# EAGLE design SmartTraffic_Shield_UNO_R3 (EAGLE 9.3.1)
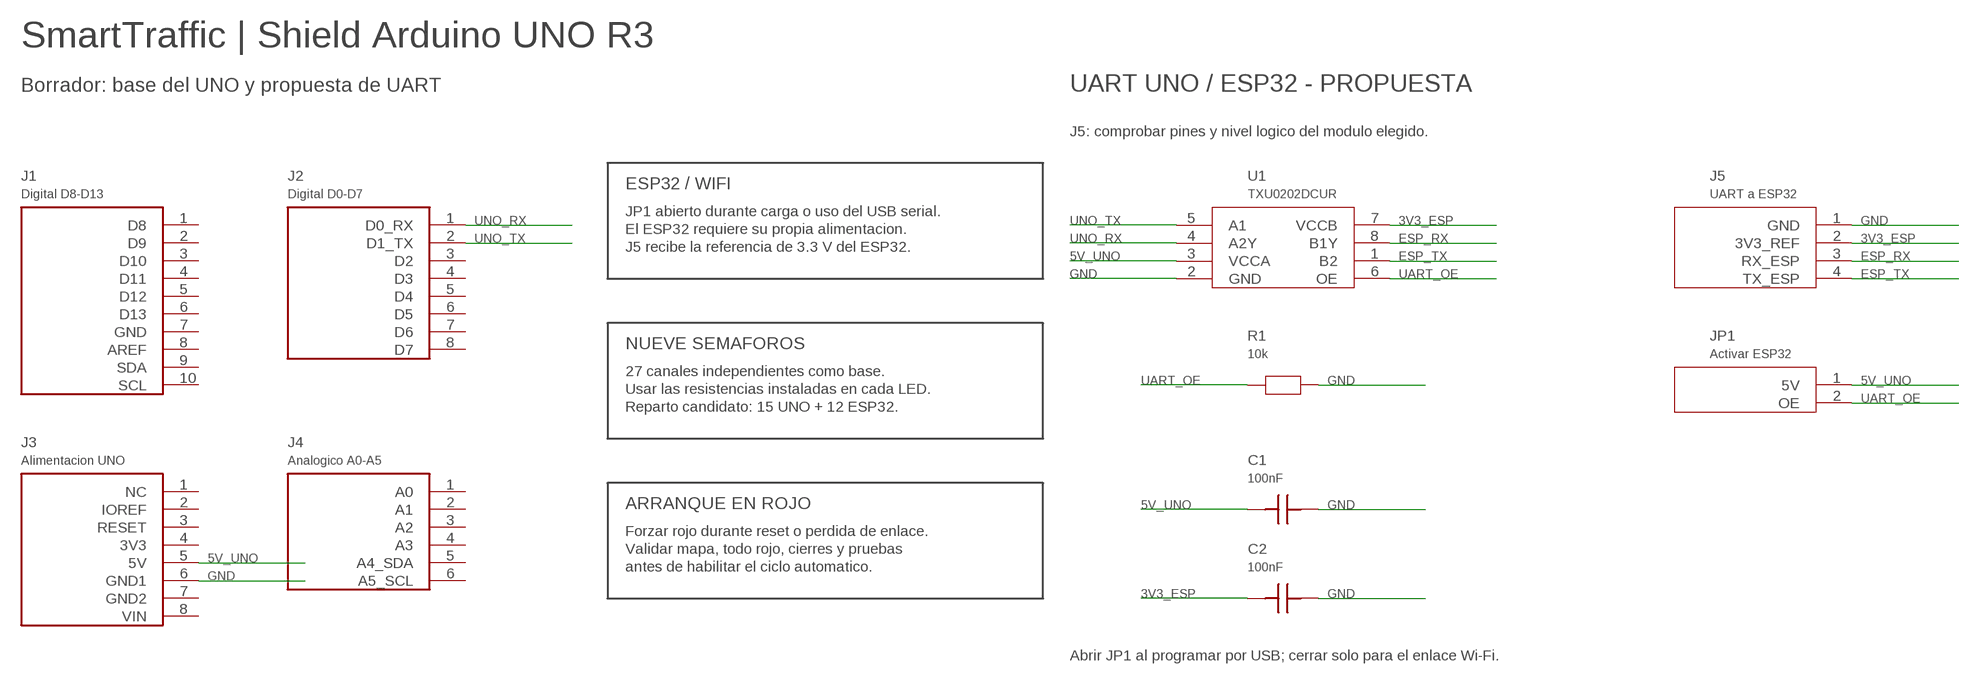
[diagram p0: schematic, sheet 1]

## Parts
C1  100nF  UART_BYPASS_5V  [C_0805]
C2  100nF  UART_BYPASS_3V3  [C_0805]
J1  Digital D8-D13  UNO_IOH  [SHIELD_1X10_P2.54]
J2  Digital D0-D7  UNO_IOL  [SHIELD_1X08_P2.54]
J3  Alimentacion UNO  UNO_POWER  [SHIELD_1X08_P2.54]
J4  Analogico A0-A5  UNO_AD  [SHIELD_1X06_P2.54]
J5  UART a ESP32  ESP32_UART  [SHIELD_1X04_P2.54]
JP1  Activar ESP32  UART_ENABLE  [SHIELD_1X02_P2.54]
R1  10k  UART_OE_PULLDOWN  [R_0805]
U1  TXU0202DCUR  UART_TXU0202  [VSSOP8_DCU0008A]

## Nets
3V3_ESP: C2.1 J5.2(3V3_REF) U1.7(VCCB)
5V_UNO: C1.1 J3.5(5V) JP1.1(5V) U1.3(VCCA)
ESP_RX: J5.3(RX_ESP) U1.8(B1Y)
ESP_TX: J5.4(TX_ESP) U1.1(B2)
GND: C1.2 C2.2 J3.6(GND1) J5.1(GND) R1.2 U1.2(GND)
UART_OE: JP1.2(OE) R1.1 U1.6(OE)
UNO_RX: J2.1(D0_RX) U1.4(A2Y)
UNO_TX: J2.2(D1_TX) U1.5(A1)
Unconnected: J1.1(D8) J1.2(D9) J1.3(D10) J1.4(D11) J1.5(D12) J1.6(D13) J1.7(GND) J1.8(AREF) J1.9(SDA) J1.10(SCL) J2.3(D2) J2.4(D3) J2.5(D4) J2.6(D5) J2.7(D6) J2.8(D7) J3.1(NC) J3.2(IOREF) J3.3(RESET) J3.4(3V3) J3.7(GND2) J3.8(VIN) J4.1(A0) J4.2(A1) J4.3(A2) J4.4(A3) J4.5(A4_SDA) J4.6(A5_SCL)

## Notes on the sheet
- SmartTraffic | Shield Arduino UNO R3
- Borrador: base del UNO y propuesta de UART | UART UNO / ESP32 - PROPUESTA
- J5: comprobar pines y nivel logico del modulo elegido.
- ESP32 / WIFI
- JP1 abierto durante carga o uso del USB serial.
- El ESP32 requiere su propia alimentacion.
- J5 recibe la referencia de 3.3 V del ESP32.
- NUEVE SEMAFOROS
- 27 canales independientes como base.
- Usar las resistencias instaladas en cada LED.
- Reparto candidato: 15 UNO + 12 ESP32.
- ARRANQUE EN ROJO
- Forzar rojo durante reset o perdida de enlace.
- Validar mapa, todo rojo, cierres y pruebas
- antes de habilitar el ciclo automatico.
- Abrir JP1 al programar por USB; cerrar solo para el enlace Wi-Fi.

## Library data of the parts
C1 = SmartTraffic_Shield:UART_BYPASS_5V
C2 = SmartTraffic_Shield:UART_BYPASS_3V3
J1 = SmartTraffic_Shield:UNO_IOH
J2 = SmartTraffic_Shield:UNO_IOL
J3 = SmartTraffic_Shield:UNO_POWER
J4 = SmartTraffic_Shield:UNO_AD
J5 = SmartTraffic_Shield:ESP32_UART
JP1 = SmartTraffic_Shield:UART_ENABLE
R1 = SmartTraffic_Shield:UART_OE_PULLDOWN
U1 = SmartTraffic_Shield:UART_TXU0202

## Net classes
0 default: width 0.254 mm, clearance 0.254 mm
1 power: width 0.61 mm, drill 0.61 mm, clearance 0.254 mm
2 gnd: width 0.305 mm, drill 0.559 mm, clearance 0.254 mm
3 usbvcc: width 0.508 mm, drill 0.61 mm, clearance 0.254 mm
4 aref: width 0.406 mm, drill 0.61 mm, clearance 0.254 mm

## Board
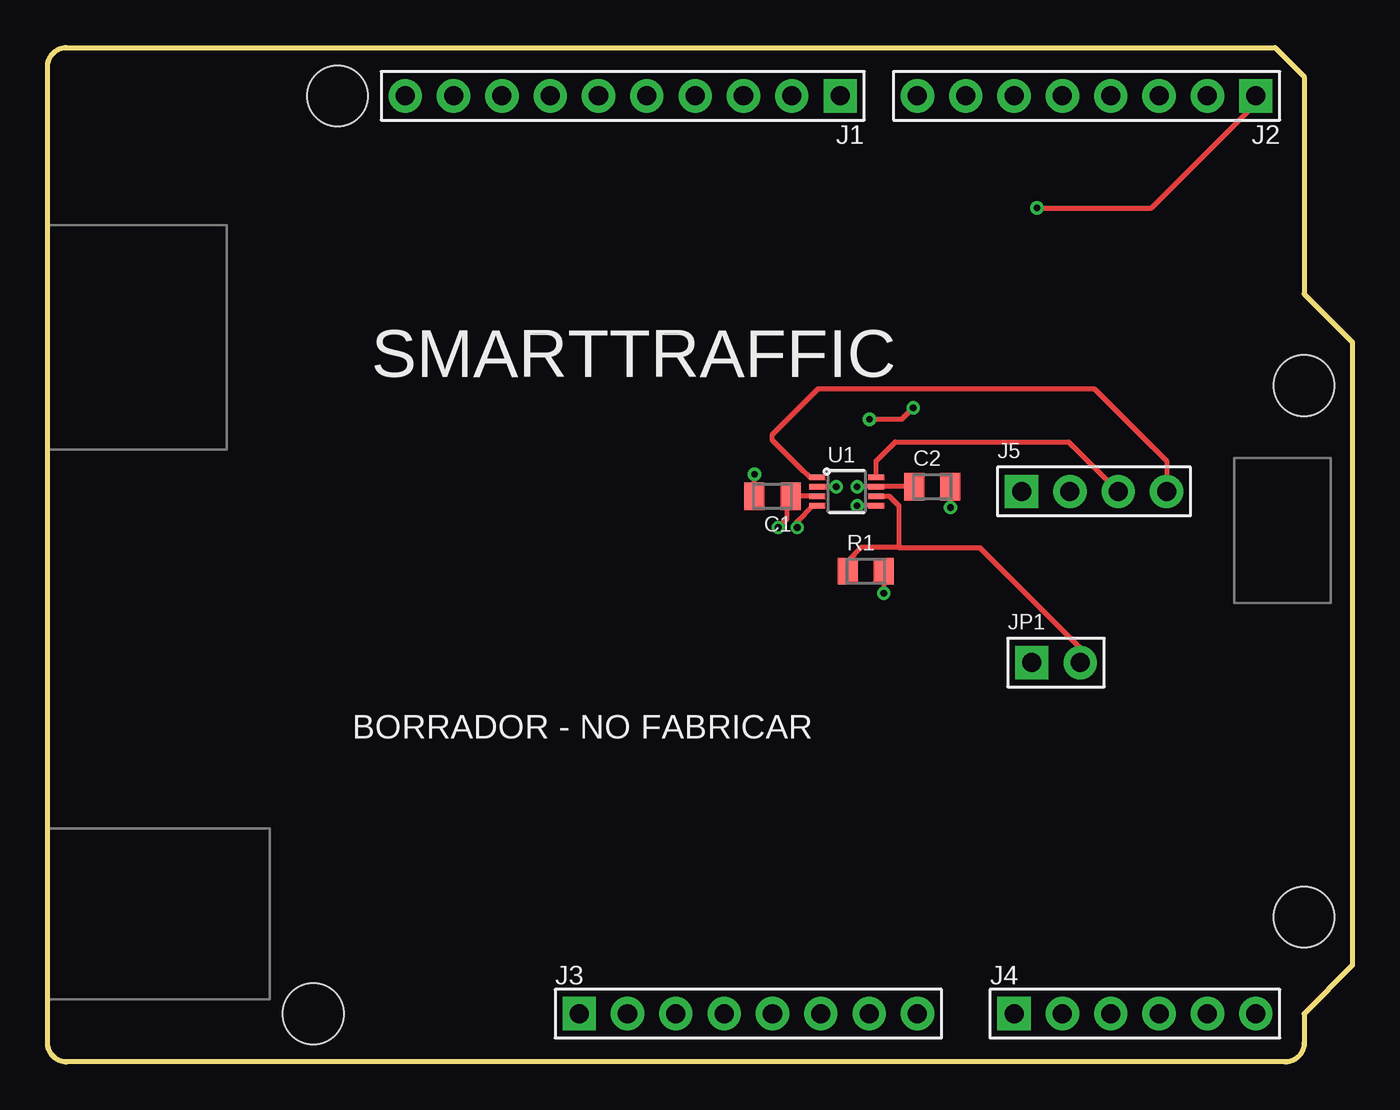
[diagram p1: board, top side]
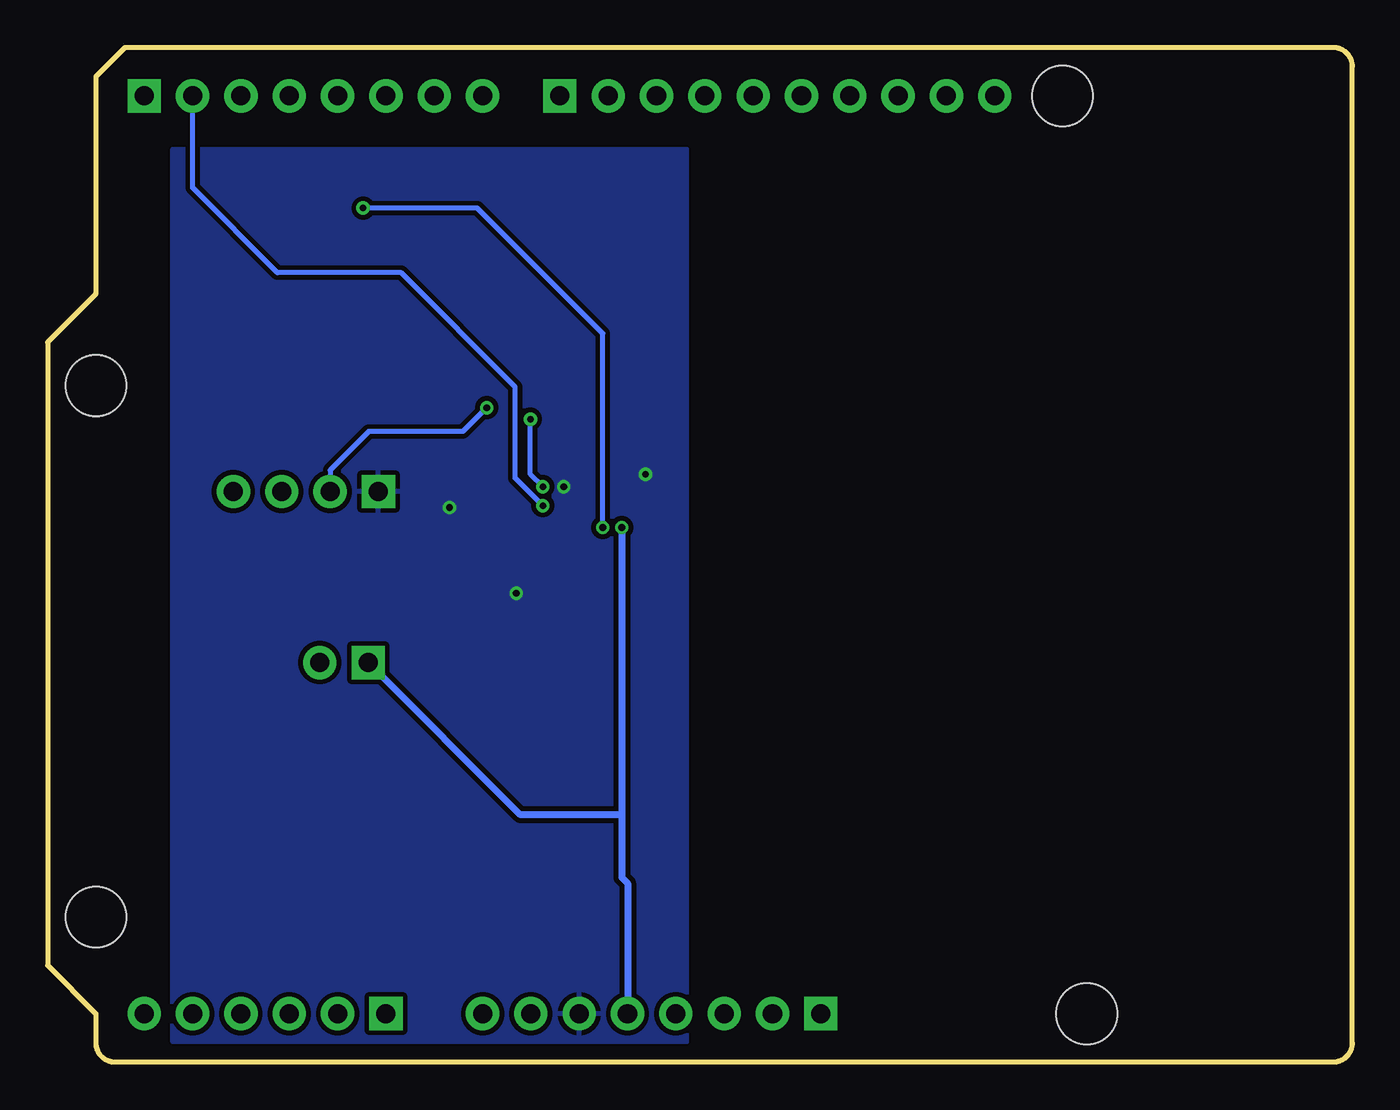
[diagram p2: board, bottom side, seen from below]

Size 68.58 x 53.34 mm. Coordinates in mm from the lower left corner, seen from the top.
Outline: 64.52,53.34 66.04,51.82 66.04,40.39 68.58,37.85 68.58,5.08 66.04,2.54 66.04,1 arc-90 65.04,0 1,0 arc-90 0,1 0,52.34 arc-90 1,53.34 64.52,53.34
Copper layers (1*16): Top 0.035mm / dielectric 1.5mm / Bottom 0.035mm
Design rules "SmartTraffic_2_capas_borrador": minimum track width 10mil, minimum drill 12mil, track to track 6mil, track to pad 6mil, pad to pad 6mil, via to via 6mil, smd to smd 6mil, copper to edge 26mil, drill to drill 12mil, minimum pad ring 10mil, minimum via ring 6mil, stop-mask expansion 1mil, vias tented up to drill 30mil, thermal gap 10mil
Holes 3.2 mm at 66.04,35.56 66.04,7.62 15.24,50.8 13.97,2.54

### Footprints (pad centres in the part's own frame; a part is rotated, then mirrored left to right if it is on the bottom)
C_0805 = smd 1.05 x 1.45: 1 -0.95,0; 2 0.95,0
SHIELD_1X10_P2.54 = drill 1 pad 1.75 square: 1 -11.43,0 | drill 1 pad 1.75 round: 2 -8.89,0; 3 -6.35,0; 4 -3.81,0; 5 -1.27,0; 6 1.27,0; 7 3.81,0; 8 6.35,0; 9 8.89,0; 10 11.43,0
SHIELD_1X08_P2.54 = drill 1 pad 1.75 square: 1 -8.89,0 | drill 1 pad 1.75 round: 2 -6.35,0; 3 -3.81,0; 4 -1.27,0; 5 1.27,0; 6 3.81,0; 7 6.35,0; 8 8.89,0
SHIELD_1X06_P2.54 = drill 1 pad 1.75 square: 1 -6.35,0 | drill 1 pad 1.75 round: 2 -3.81,0; 3 -1.27,0; 4 1.27,0; 5 3.81,0; 6 6.35,0
SHIELD_1X04_P2.54 = drill 1 pad 1.75 square: 1 -3.81,0 | drill 1 pad 1.75 round: 2 -1.27,0; 3 1.27,0; 4 3.81,0
SHIELD_1X02_P2.54 = drill 1 pad 1.75 square: 1 -1.27,0 | drill 1 pad 1.75 round: 2 1.27,0
R_0805 = smd 1.05 x 1.4: 1 -0.95,0; 2 0.95,0
VSSOP8_DCU0008A = smd 0.85 x 0.3: 1 -1.55,0.75; 2 -1.55,0.25; 3 -1.55,-0.25; 4 -1.55,-0.75; 5 1.55,-0.75; 6 1.55,-0.25; 7 1.55,0.25; 8 1.55,0.75

### Placement (x,y rotation side)
C1  38.1,29.75 180 top
C2  46.5,30.25 0 top
J1  30.23,50.8 180 top
J2  54.61,50.8 180 top
J3  36.83,2.54 0 top
J4  57.15,2.54 0 top
J5  55,30 0 top
JP1  53,21 0 top
R1  43,25.8 0 top
U1  42,30 0 top

### Tracks (layer width: path | path; a pad name or v marks a point on that pad's centre or on a via)
3V3_ESP  (via drill 0.35 pad 0.7)
  Top 0.254: C2.1 U1.7 v42.55,30.25 | v43.2,33.8 44.9,33.8 v45.5,34.4
  Bottom 0.254: v42.55,30.25 43.2,30.9 v43.2,33.8 | v45.5,34.4 46.75,33.15 51.7,33.15 53.73,31.12 J5.2
5V_UNO  (via drill 0.35 pad 0.7)
  Top 0.254: U1.3 C1.1 39.05,29.35 38.85,29.15 38.85,28.55 v38.4,28.1
  Bottom 0.381: v38.4,28.1 38.4,13 | 38.4,13 38.4,9.7 38.1,9.4 J3.5 | 38.4,13 43.73,13 JP1.1
ESP_RX
  Top 0.254: U1.8 43.55,31.6 44.55,32.6 53.67,32.6 J5.3
ESP_TX
  Top 0.254: U1.1 40.05,30.75 39.75,31.05 38.1,32.7 38.1,33 40.5,35.4 55,35.4 58.81,31.59 J5.4
GND  (via drill 0.35 pad 0.7)
  Top 0.254: U1.2 v41.45,30.25 | C1.2 v37.15,30.9 | C2.2 v47.45,29.15 | R1.2 v43.95,24.65
  pour Bottom (isolate 0.203, rank 2): 35,1.05 62,1.05 62,48 35,48
UART_OE
  Top 0.254: U1.6 44.24,29.75 44.74,29.25 44.74,27.05 | 44.74,27.05 42.75,27.05 42.05,26.35 R1.1 | 44.74,27.05 49,27.05 54.27,21.78 JP1.2
UNO_RX  (via drill 0.35 pad 0.7)
  Top 0.254: U1.4 40.22,29.25 39.4,28.43 v39.4,28.1 | v52,44.9 58,44.9 63.5,50.4 J2.1
  Bottom 0.254: v39.4,28.1 39.4,38.3 46,44.9 v52,44.9
UNO_TX  (via drill 0.35 pad 0.7)
  Top 0.254: U1.5 v42.55,29.25
  Bottom 0.254: v42.55,29.25 44,30.7 44,35.5 50,41.5 56.5,41.5 60.96,45.96 J2.2

### Text on the board
tPlace: SMARTTRAFFIC | BORRADOR - NO FABRICAR
tDocu: USB-B | ICSP | Jack DC